# Altium schematic sheet MCU.SchDoc
size A4; SheetNumber: 1; SheetTotal: 3
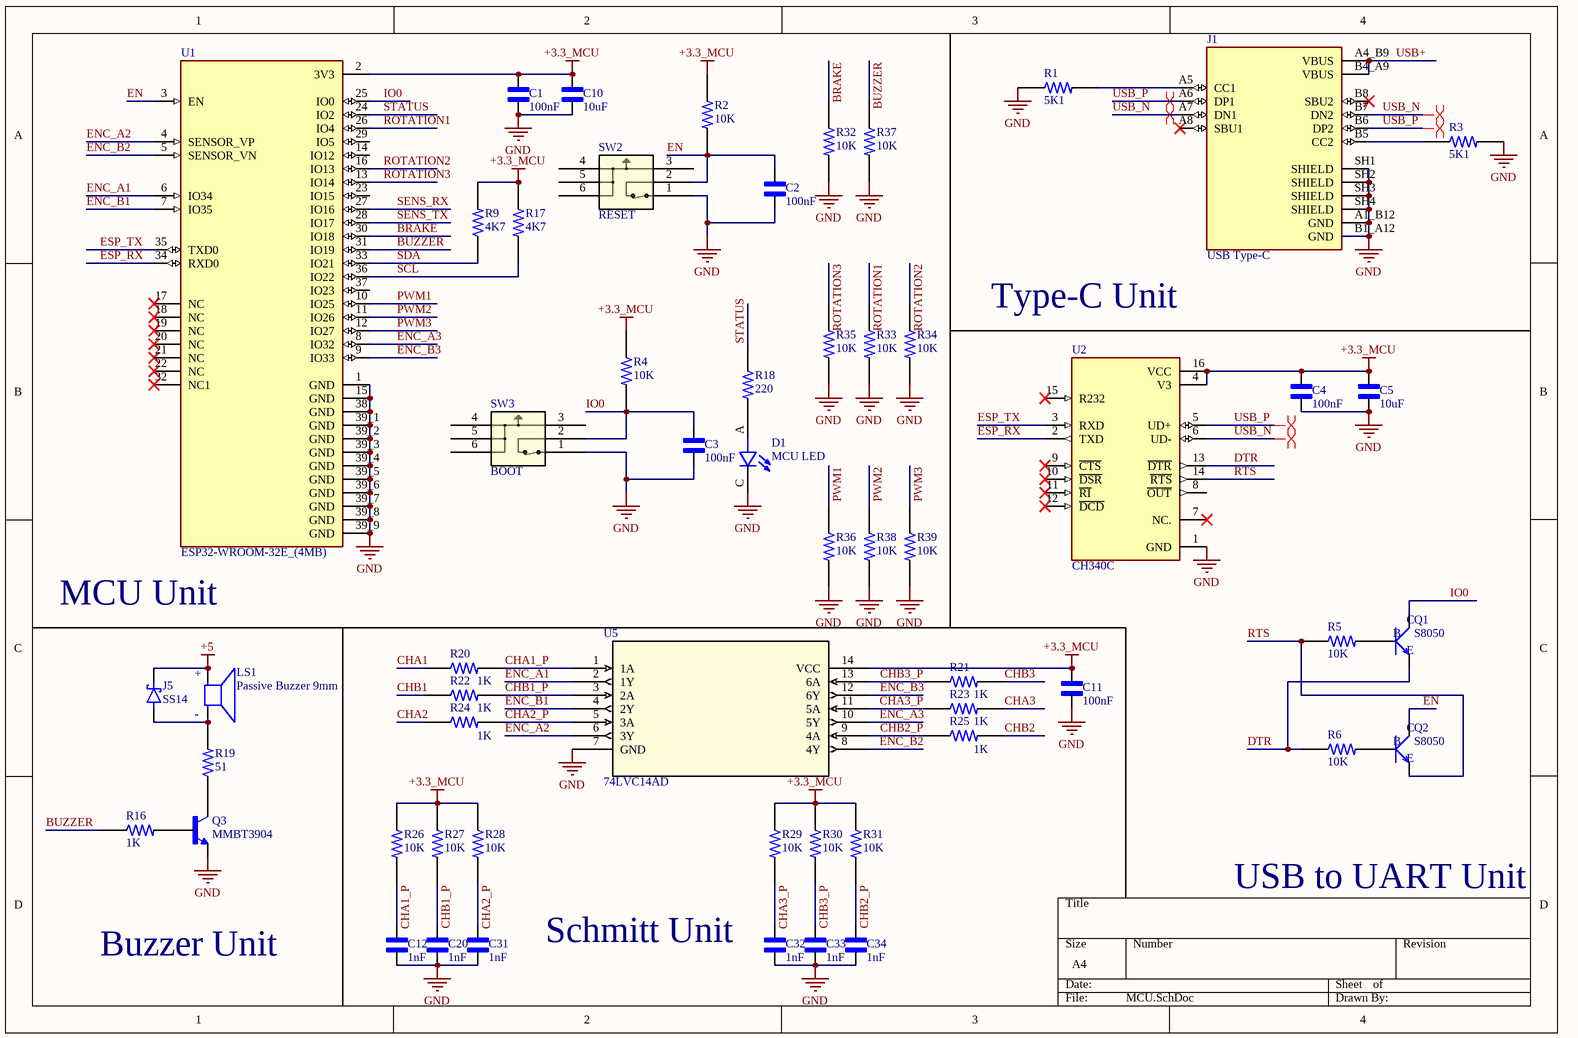
[diagram p0: MCU.SchDoc]

## Parts
C1  100nF  [CAPC1608X90N]
C2  100nF  [CAPC1608X90N]
C3  100nF  [CAPC1608X90N]
C4  100nF  [CAPC1608X90N]
C5  10uF  [CAPC1608X90N]
C10  10uF  [CAPC1608X90N]
C11  100nF  [CAPC1608X90N]
C12  1nF  [CAPC1608X90N]
C20  1nF  [CAPC1608X90N]
C31  1nF  [CAPC1608X90N]
C32  1nF  [CAPC1608X90N]
C33  1nF  [CAPC1608X90N]
C34  1nF  [CAPC1608X90N]
D1  MCU LED  [LEDSC125X200X90-2N]
J1  USB Type-C  [AMPHENOL_10155435-00011LF]
J5  SS14  [SMA]
LS1  Passive Buzzer 9mm  [XDCR_AT-0927-TT-2-R]
Q1  S8050  [SOT-23]
Q2  S8050  [SOT-23]
Q3  MMBT3904  [TRANS_MMBT3904]
R1  5K1  [RESC1607X60N]
R2  10K  [RESC1607X60N]
R3  5K1  [RESC1607X60N]
R4  10K  [RESC1607X60N]
R5  10K  [RESC1607X60N]
R6  10K  [RESC1607X60N]
R9  4K7  [RESC1607X60N]
R16  1K  [RESC1607X60N]
R17  4K7  [RESC1607X60N]
R18  220  [RESC1607X60N]
R19  51  [RESC1607X60N]
R20  1K  [RESC1607X60N]
R21  1K  [RESC1607X60N]
R22  1K  [RESC1607X60N]
R23  1K  [RESC1607X60N]
R24  1K  [RESC1607X60N]
R25  1K  [RESC1607X60N]
R26  10K  [RESC1607X60N]
R27  10K  [RESC1607X60N]
R28  10K  [RESC1607X60N]
R29  10K  [RESC1607X60N]
R30  10K  [RESC1607X60N]
R31  10K  [RESC1607X60N]
R32  10K  [RESC1607X60N]
R33  10K  [RESC1607X60N]
R34  10K  [RESC1607X60N]
R35  10K  [RESC1607X60N]
R36  10K  [RESC1607X60N]
R37  10K  [RESC1607X60N]
R38  10K  [RESC1607X60N]
R39  10K  [RESC1607X60N]
SW2  RESET  [PTS820 J25K SMTR LFS_CNK]
SW3  BOOT  [PTS820 J25K SMTR LFS_CNK]
U1  ESP32-WROOM-32E_(4MB)  [XCVR_ESP32-WROOM-32E_(4MB)]
U2  CH340C  [SOIC127P600X180-16N]
U5  74LVC14AD  [SOT108-1_NXP]

## Nets
+3.3_MCU: C1.2 C4.2 C5.2 C10.2 C11.2 R2.1 R4.1 R9.2 R17.1 R26.1 R27.1 R28.1 R29.1 R30.1 R31.1 U1.2(3V3) U2.4(V3) U2.16(VCC) U5.14(VCC)
+5: J5.P2(C) LS1.P
GND: C1.1 C2.1 C3.1 C4.1 C5.1 C10.1 C11.1 C12.2 C20.2 C31.2 C32.2 C33.2 C34.2 D1.C J1.A1_B12(GND) J1.B1_A12(GND) J1.SH1(SHIELD) J1.SH2(SHIELD) J1.SH3(SHIELD) J1.SH4(SHIELD) Q3.2(E) R1.1 R3.2 R32.2 R33.2 R34.2 R35.2 R36.2 R37.2 R38.2 R39.2 SW2.1 SW3.1 U1.1(GND) U1.15(GND) U1.38(GND) U1.39_1(GND) U1.39_2(GND) U1.39_3(GND) U1.39_4(GND) U1.39_5(GND) U1.39_6(GND) U1.39_7(GND) U1.39_8(GND) U1.39_9(GND) U2.1(GND) U5.7(GND)
BRAKE: R32.1 U1.30(IO18)
BUZZER: R16.1 R37.1 U1.31(IO19)
CHA1: R20.1
CHA1_P: C12.1 R20.2 R26.2 U5.1(1A)
CHA2: R24.1
CHA2_P: C31.1 R24.2 R28.2 U5.5(3A)
CHA3: R23.2
CHA3_P: C32.1 R23.1 R29.2 U5.11(5A)
CHB1: R22.1
CHB1_P: C20.1 R22.2 R27.2 U5.3(2A)
CHB2: R25.2
CHB2_P: C34.1 R25.1 R31.2 U5.9(4A)
CHB3: R21.2
CHB3_P: C33.1 R21.1 R30.2 U5.13(6A)
DTR: Q1.2(E) R6.1 U2.13(~{DTR})
EN: C2.2 Q2.3(C) R2.2 SW2.2 U1.3(EN)
ENC_A1: U1.6(IO34) U5.2(1Y)
ENC_A2: U1.4(SENSOR_VP) U5.6(3Y)
ENC_A3: U1.8(IO32) U5.10(5Y)
ENC_B1: U1.7(IO35) U5.4(2Y)
ENC_B2: U1.5(SENSOR_VN) U5.8(4Y)
ENC_B3: U1.9(IO33) U5.12(6Y)
ESP_RX: U1.34(RXD0) U2.2(TXD)
ESP_TX: U1.35(TXD0) U2.3(RXD)
IO0: C3.2 Q1.3(C) R4.2 SW3.2 U1.25(IO0)
PWM1: R36.1 U1.10(IO25)
PWM2: R38.1 U1.11(IO26)
PWM3: R39.1 U1.12(IO27)
ROTATION1: R33.1 U1.26(IO4)
ROTATION2: R34.1 U1.16(IO13)
ROTATION3: R35.1 U1.13(IO14)
RTS: Q2.2(E) R5.1 U2.14(~{RTS})
SCL: R17.2 U1.36(IO22)
SDA: R9.1 U1.33(IO21)
SENS_RX: U1.27(IO16)
SENS_TX: U1.28(IO17)
STATUS: R18.1 U1.24(IO2)
USB+: J1.A4_B9(VBUS) J1.B4_A9(VBUS)
USB_N: J1.A7(DN1) J1.B7(DN2) U2.6(UD-)
USB_P: J1.A6(DP1) J1.B6(DP2) U2.5(UD+)
NetD1_A: D1.A R18.2
NetJ1_A5: J1.A5(CC1) R1.2
NetJ1_B5: J1.B5(CC2) R3.1
NetJ5_P1: J5.P1(A) LS1.N R19.2
NetQ1_1: Q1.1(B) R5.2
NetQ2_1: Q2.1(B) R6.2
NetQ3_1: Q3.1(B) R16.2
NetQ3_3: Q3.3(C) R19.1

Not connected (* = marked no-connect by the designer): J1 A8(SBU1)* B8(SBU2)*; SW2 3 4 5 6; SW3 3 4 5 6; U1 14(IO12) 17(NC)* 18(NC)* 19(NC)* 20(NC)* 21(NC)* 22(NC)* 23(IO15) 29(IO5) 32(NC1)* 37(IO23); U2 7(NC.)* 8(~{OUT}) 9(~{CTS})* 10(~{DSR})* 11(~{RI})* 12(~{DCD})* 15(R232)*

## Layout directives
differential pair: USB_N, USB_P

## Notes on the sheet
- Type-C Unit
- (near U1) MCU Unit
- USB to UART Unit
- Buzzer Unit
- (near C32) Schmitt Unit
- (in symbol AT-0927-TT-2-R) +; -

## Library data of the parts
C1-C5 C10 C11 = GRM188R71H104KA93D: SMD Capacitor X7R(EIA) with Capacitance: 0.10uF Tol. 10%. Rated Voltage: 50Vdc; MF: Murata; SnapEDA_Link: https://www.snapeda.com/parts/GRM188R71H104KA93D/Murata/view-part/?ref=snap; Package: 1608 Murata; Value: *; MP: GRM188R71H104KA93D; Check_prices: https://www.snapeda.com/parts/GRM188R71H104KA93D/Murata/view-part/?ref=eda
C12 C20 C31-C34 = GRM188R71H102KA01D: SMD Capacitor X7R(EIA) with Capacitance: 1000pF Tol. 10%. Rated Voltage: 50Vdc; MF: Murata; SnapEDA_Link: https://www.snapeda.com/parts/GRM188R71H102KA01D/Murata/view-part/?ref=snap; Package: 1608 Murata; Value: *; MP: GRM188R71H102KA01D; Check_prices: https://www.snapeda.com/parts/GRM188R71H102KA01D/Murata/view-part/?ref=eda
D1 = 5990110007F: Red 633nm LED Indication - Discrete 2.1V 0805 (2012 Metric); MF: Dialight; MP: 599-0110-007F; Check_prices: https://www.snapeda.com/parts/599-0110-007F/Dialight/view-part/?ref=eda; Value: *; Purchase-URL: https://pricing.snapeda.com/search/part/599-0110-007F/?ref=eda; Price: None; SnapEDA_Link: https://www.snapeda.com/parts/599-0110-007F/Dialight/view-part/?ref=snap; Availability: In Stock; Package: 0805 Dialight
J1 = 10155435-00011LF: Package: None; Price: None; Value: *; MP: 10155435-00011LF; Availability: Unavailable
J5 = SS14: Diode Schottky 40 V 1A Surface Mount DO-214AC (SMA); MF: onsemi; SnapEDA_Link: https://www.snapeda.com/parts/SS14/Onsemi/view-part/?ref=snap; Package: SMA-2 ON Semiconductor; Value: *; MP: SS14; Check_prices: https://www.snapeda.com/parts/SS14/Onsemi/view-part/?ref=eda
LS1 = AT-0927-TT-2-R: AUDIO TRANSDUCER 3VP-P 70MA 20OHM 86DBA; MF: {'manufacturer': u'PUI Audio, Inc.'}; Package: None; Price: None; Value: *; MP: AT-0927-TT-2-R; Availability: Unavailable
Q1 Q2 = SMD-TRANSISTORS-NPN-25V-500MW(SOT-23): Bipolar (BJT) Transistor NPN 25 V 500 mA 150MHz 300 mW Surface Mount SOT-23; MF: UMW; Purchase-URL: https://pricing.snapeda.com/search/part/S8050/?ref=eda; Check_prices: https://www.snapeda.com/parts/S8050/Umwelt+Sensor+Teknik/view-part/?ref=eda; SnapEDA_Link: https://www.snapeda.com/parts/S8050/Umwelt+Sensor+Teknik/view-part/?ref=snap; Price: None; Availability: In Stock; Package: None; MP: S8050; Value: *
Q3 = MMBT3904: BJT, SOT-23, 40V, 200mA, NPN, 0.35W, 150Â°C; MF: Diotec Semiconductor; SnapEDA_Link: https://www.snapeda.com/parts/MMBT3904/Diotec/view-part/?ref=snap; Package: SOT-23 Diotec; Value: *; MP: MMBT3904; Check_prices: https://www.snapeda.com/parts/MMBT3904/Diotec/view-part/?ref=eda
R1-R6 R9 R16-R39 = RC0603FR-071K2L: 1.2 kOhms Â±1% 0.1W, 1/10W Chip Resistor 0603 (1608 Metric) Moisture Resistant Thick Film; MF: Yageo; SnapEDA_Link: https://www.snapeda.com/parts/RC0603FR-071K2L/Yageo/view-part/?ref=snap; Package: SMD-2 Yageo; Value: *; MP: RC0603FR-071K2L; Check_prices: https://www.snapeda.com/parts/RC0603FR-071K2L/Yageo/view-part/?ref=eda
SW2 SW3 = PTS820 J25K SMTR LFS: Description; Manufacturer_Name: C&K Components; Copyright: Copyright (C) 2026 Ultra Librarian. All rights reserved.; Manufacturer_Part_Number: PTS820 J25K SMTR LFS; RefDes: RefDes; Type: Type
U1 = ESP32-WROOM-32E_(4MB): Bluetooth, WiFi 802.11b/g/n, Bluetooth v4.2 +EDR, Class 1, 2 and 3 Transceiver Module 2.4GHz ~ 2.5GHz Integrated, Trace Surface Mount; MF: Espressif Systems; MP: ESP32-WROOM-32E (4MB); SnapEDA_Link: https://www.snapeda.com/parts/ESP32-WROOM-32E%20(4MB)/Espressif+Systems/view-part/?ref=snap; Package: SMD-44 Espressif Systems; Value: *; Check_prices: https://www.snapeda.com/parts/ESP32-WROOM-32E%20(4MB)/Espressif+Systems/view-part/?ref=eda
U2 = CH340C: USB to serial chip CH340; MF: WCH; Price: None; Availability: Not in stock; MP: CH340C; Package: None; SnapEDA_Link: https://www.snapeda.com/parts/CH340C/WCH/view-part/?ref=snap; Check_prices: https://www.snapeda.com/parts/CH340C/WCH/view-part/?ref=eda; Value: *
U5 = 74LVC14AD: Description; Manufacturer_Name: NXP; Copyright: Copyright (C) 2026 Ultra Librarian. All rights reserved.; Manufacturer_Part_Number: 74LVC14AD; RefDes: RefDes; Type: Type